# Altium project IndoorGuide_Anchor_Device_V1.0.0.PrjPcb
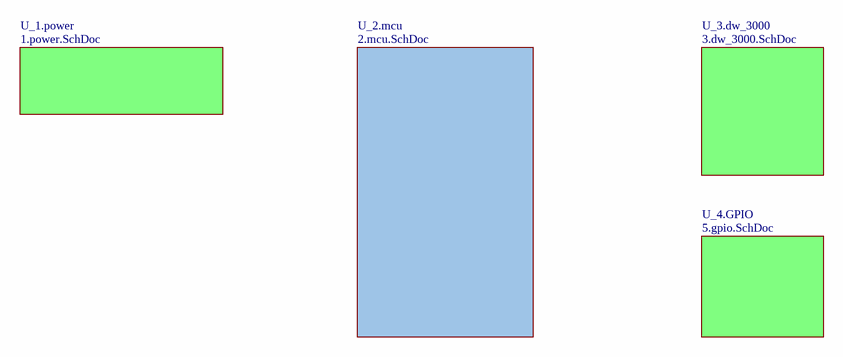
[diagram p0: 0.main.SchDoc]
Drawnby: FYP20-G22; Revision: 1.0.0; title: Indoor_Guide_Anchor_Device_V1.0.0
5 sheets, 12 parts. Net scope: hierarchical (ports join the sheet entries above them; power ports are global).
Board file: IndoorGuide_Anchor_Device_V1.0.0.PcbDoc
Sheets:
  0.main.SchDoc
    U_1.power = 1.power.SchDoc
    U_2.mcu = 2.mcu.SchDoc
    U_3.dw_3000 = 3.dw_3000.SchDoc
    U_4.GPIO = 5.gpio.SchDoc

## Sheet 0.main.SchDoc: Indoor_Guide_Anchor_Device_V1.0.0
size A4; Organization: ORGANIZATION; Address1: ADDRESS 1; Address2: ADDRESS 2; Address3: ADDRESS 3; Address4: ADDRESS 4; DocumentNumber: 1; SheetNumber: 1; SheetTotal: 5; ENG_APP_DATE: --/--/--; DSN_APP_DATE: --/--/--; CHK_APP_DATE: --/--/--; Page: Top

### Sub-sheets
U_1.power = 1.power.SchDoc: no entries
U_2.mcu = 2.mcu.SchDoc: no entries
U_3.dw_3000 = 3.dw_3000.SchDoc: no entries
U_4.GPIO = 5.gpio.SchDoc: no entries

### Notes on the sheet
- Title :
- Size:
- Date:
- Page :
- A4
- Number:
- Time:
- Revision:
- Sheet
- of
- Sheet Name :
- Drawn By :

## Sheet 1.power.SchDoc: Indoor_Guide_Anchor_Device_V1.0.0
size A4; Organization: ORGANIZATION; Address1: ADDRESS 1; Address2: ADDRESS 2; Address3: ADDRESS 3; Address4: ADDRESS 4; DocumentNumber: 2; SheetNumber: 2; SheetTotal: 5; ENG_APP_DATE: --/--/--; DSN_APP_DATE: --/--/--; CHK_APP_DATE: --/--/--; Page: Power Section
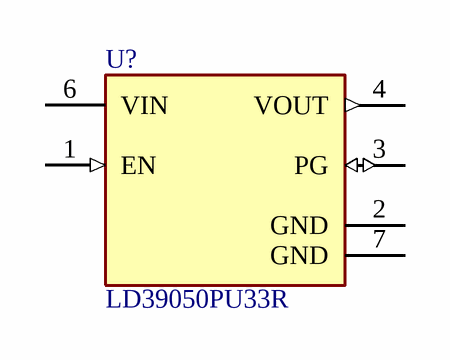
[diagram p1: 1.power.SchDoc]

### Parts
(Parts that share a designator on the sheet are numbered #1, #2 ... from top to bottom, then left to right.)
U?#1  LD39050PU33R  [SON95P300X300X100-7N]

### Nets

Not connected (* = marked no-connect by the designer): U?#1 1(EN) 2(GND) 3(PG) 4(VOUT) 6(VIN) 7(GND)

### Notes on the sheet
- Title :
- Size:
- Date:
- Page :
- A4
- Number:
- Time:
- Revision:
- Sheet
- of
- Sheet Name :
- Drawn By :

### Library data of the parts
U?#1 = LD39050PU33R: Linear Voltage Regulator IC Positive Fixed 1 Output 500mA 6-DFN (3x3); MF: STMicroelectronics; SnapEDA_Link: https://www.snapeda.com/parts/LD39050PU33R/STMicroelectronics/view-part/?ref=snap; Package: DFN-6 STMicroelectronics; Value: *; MP: LD39050PU33R; Check_prices: https://www.snapeda.com/parts/LD39050PU33R/STMicroelectronics/view-part/?ref=eda

## Sheet 2.mcu.SchDoc: Indoor_Guide_Anchor_Device_V1.0.0
size A4; Organization: ORGANIZATION; Address1: ADDRESS 1; Address2: ADDRESS 2; Address3: ADDRESS 3; Address4: ADDRESS 4; DocumentNumber: 3; SheetNumber: 3; SheetTotal: 5; ENG_APP_DATE: --/--/--; DSN_APP_DATE: --/--/--; CHK_APP_DATE: --/--/--; Page: MCU
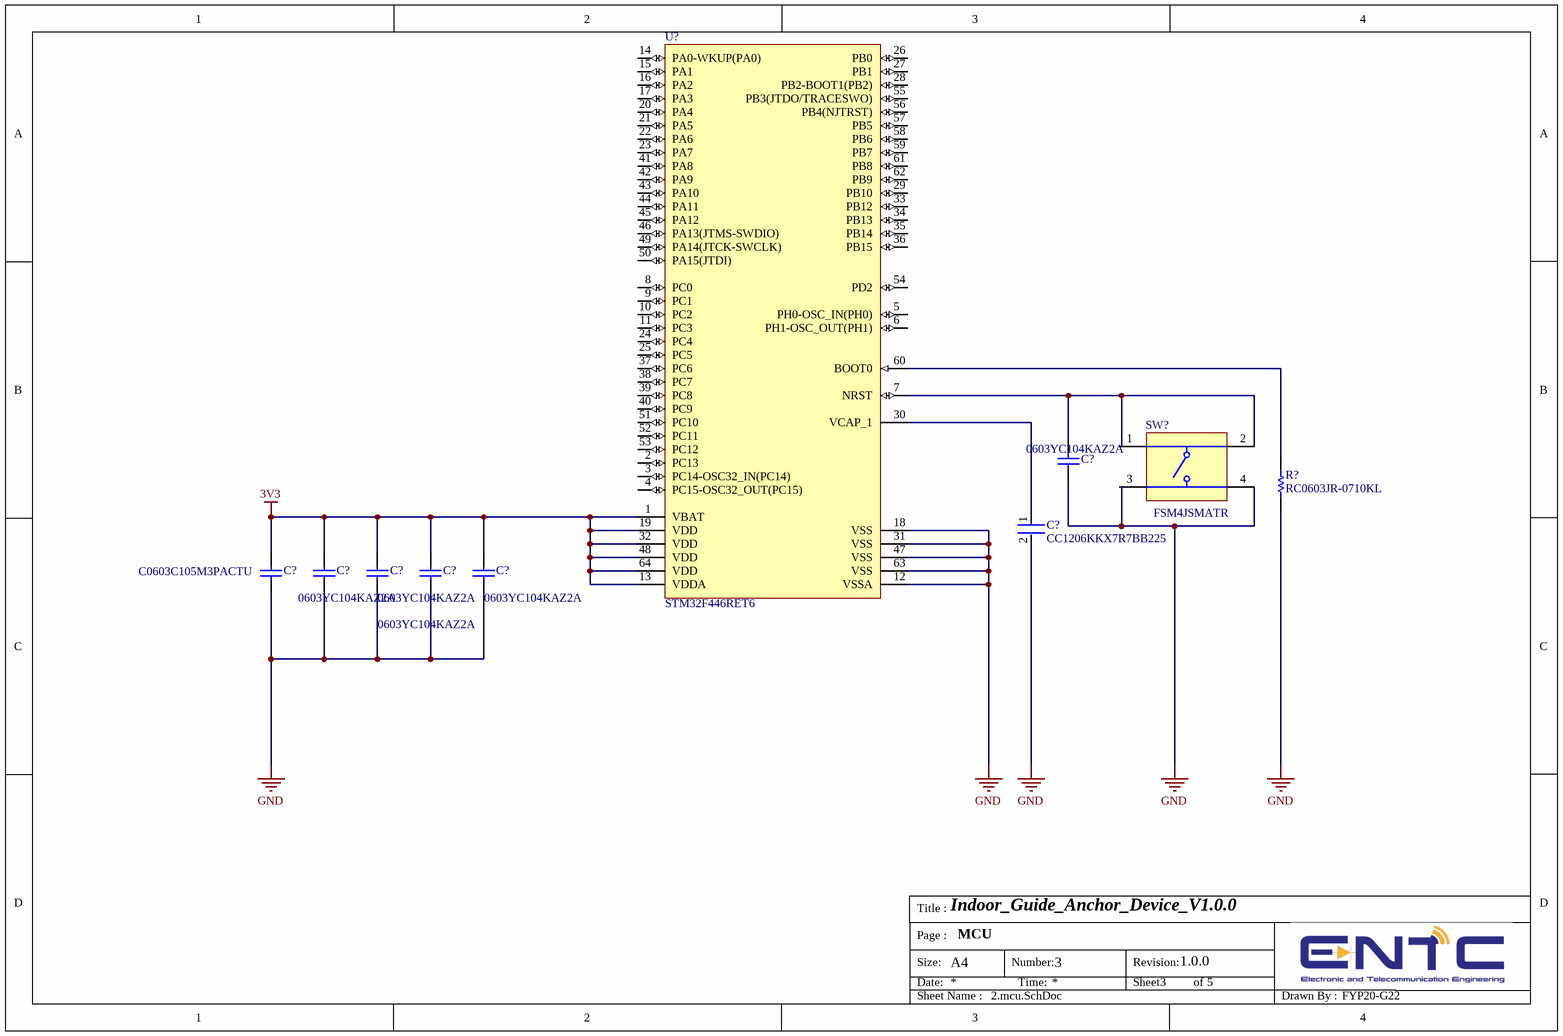
[diagram p2: 2.mcu.SchDoc]

### Parts
(Parts that share a designator on the sheet are numbered #1, #2 ... from top to bottom, then left to right.)
C?#1  0603YC104KAZ2A  [CAPC1608X90X35ML15T15]
C?#2  CC1206KKX7R7BB225  [FP-CC1206-1_25-MFG]
C?#3  C0603C105M3PACTU  [CAPC1608X90X35ML15T15]
C?#4  0603YC104KAZ2A  [CAPC1608X90X35ML15T15]
C?#5  0603YC104KAZ2A  [CAPC1608X90X35ML15T15]
C?#6  0603YC104KAZ2A  [CAPC1608X90X35ML15T15]
C?#7  0603YC104KAZ2A  [CAPC1608X90X35ML15T15]
R?  RC0603JR-0710KL  [RESC1608X55X25ML10T15]
SW?  FSM4JSMATR  [TECO-FSM4JSMATR_V]
U?#2  STM32F446RET6

### Nets
3V3: C?#3.2 C?#4.2 C?#5.2 C?#6.2 C?#7.2 U?#2.1(VBAT) U?#2.13(VDDA) U?#2.19(VDD) U?#2.32(VDD) U?#2.48(VDD) U?#2.64(VDD)
GND: C?#1.1 C?#2.2 C?#3.1 C?#4.1 C?#5.1 C?#6.1 C?#7.1 R?.1 SW?.3 SW?.4 U?#2.12(VSSA) U?#2.18(VSS) U?#2.31(VSS) U?#2.47(VSS) U?#2.63(VSS)
NetC?#1_2: C?#1.2 SW?.1 SW?.2 U?#2.7(NRST)
NetC?#2_1: C?#2.1 U?#2.30(VCAP_1)
NetR?_2: R?.2 U?#2.60(BOOT0)

Not connected (* = marked no-connect by the designer): U?#2 2(PC13) 3(PC14-OSC32_IN(PC14)) 4(PC15-OSC32_OUT(PC15)) 5(PH0-OSC_IN(PH0)) 6(PH1-OSC_OUT(PH1)) 8(PC0) 9(PC1) 10(PC2) 11(PC3) 14(PA0-WKUP(PA0)) 15(PA1) 16(PA2) 17(PA3) 20(PA4) 21(PA5) 22(PA6) 23(PA7) 24(PC4) 25(PC5) 26(PB0) 27(PB1) 28(PB2-BOOT1(PB2)) 29(PB10) 33(PB12) 34(PB13) 35(PB14) 36(PB15) 37(PC6) 38(PC7) 39(PC8) 40(PC9) 41(PA8) 42(PA9) 43(PA10) 44(PA11) 45(PA12) 46(PA13(JTMS-SWDIO)) 49(PA14(JTCK-SWCLK)) 50(PA15(JTDI)) 51(PC10) 52(PC11) 53(PC12) 54(PD2) 55(PB3(JTDO/TRACESWO)) 56(PB4(NJTRST)) 57(PB5) 58(PB6) 59(PB7) 61(PB8) 62(PB9)

### Notes on the sheet
- Title :
- Size:
- Date:
- Page :
- A4
- Number:
- Time:
- Revision:
- Sheet
- of
- Sheet Name :
- Drawn By :

### Library data of the parts
C?#1 C?#4-C?#7 = CMP-2006-04496-1: Manufacturer: AVX Interconnect / Elco; Part Number: 0603YC104KAZ2A
C?#2 = CMP-03422-001173-2: CAP CER 2.2UF 16V X7R 1206; Manufacturer: Yageo; Temperature Coefficient: 15%; Tolerance: 0.1; Material: Ceramic; Automotive Grade: NA; Lead Free: Yes; Device Class L3: Ceramic Capacitors; ComponentLink2Description: Datasheet; Device Class L2: Capacitors; Device Class L1: Passive Components; Mouser Description: Surface Mount Ceramic Multilayer Capacitor 2.2uF 10% X7R 16V 1206 Blister T/R; Octopart: https://octopart.com/cc1206kkx7r7bb225-yageo-8376579; Automotive: No; Voltage Rating: 16 V; Temperature Characteristic: X7R; Height: 1.45mm; Temperature: -55°C to +125°C; ComponentLink2URL: http://www.yageo.com/documents/recent/UPY-NP0X7R_HV_1KV-to-3KV_11.pdf; Digikey Description: CAP CER 2.2UF 16V X7R 1206; RoHS: TRUE; Capacitance: 2.2 uF; Footprint Url: http://www.yageo.com/exep/pages/download/literatures/UPY-C_GEN_24.pdf; Value: 2.2 uF; Category: Cap; Temperature Range Low: -55°C; Temperature Range High: +125°C; Manufacturer Part Number: CC1206KKX7R7BB225; Package: CC1206-1.25
C?#3 = CMP-1035-02741-2: Manufacturer: Kemet; Part Number: C0603C105M3PACTU
R? = CMP-2000-05022-1: Resistor, 10 KOhm, +/- 5%, 100 mW, -55 to 155 degC, 0603 (1608 Metric), RoHS, Tape and Reel; Manufacturer: Yageo; Resistance: 10kOhms; Voltage Rating: 50V; Temperature Coefficient: 100PPM/C; Power Rating: 100mW; Package Reference: 603; Series: RC; Case Code - mm: 1608; Packaging: Reel; Datasheet URL: http://www.farnell.com/datasheets/443971.pdf; Datasheet Version: Rev. 4, 04/2009; Operating Temperature Range: -55Cto+155C; Product: ThickFilmResistorsGeneralPurpose; Package Description: 2-Pin Surface Mount Device, Body 1.6 x 0.8 mm; Manufacturer URL: http://www.yageo.com/; Case Code - in: 0603; Tolerance: 5%; Termination Style: SMD/SMT
SW? = CMP-2000-07486-1: Micro Miniature Push Button Switch FSM JSM, 50 mA, -35 to 85 degC, 4-Pin SMD, RoHS, Tape and Reel; Manufacturer: TE Connectivity; Mechanical Life: 100000Cycles; Current Rating: 50mA; Actuator Material: Polyamide; Max Voltage Rating (DC): 12V; Capacitance: 0f; Illumination Type: Illuminated; Voltage Rating (DC): 24V; Case\/Package: SMD/SMT; Operating Force: 160gf; Contact Resistance: 100mOhm; Actuator Length: 0.055inch; Switch Travel: 0.25mm; Throw Configuration: SPST; Termination: GullWing; Contact Plating: Silver; Orientation: Straight; Mounting Technology: SurfaceMount; REACH SVHC: Unknown; Electrical Life: 100000Cycles; Package Reference: FSM4JSMATR; Max Operating Temperature: 85degC; Manufacturer URL: http://www.te.com/; Package Description: 4-Pin Surface Mount Device, Body 6 x 6 mm, Pitch 4.5 mm; Datasheet Version: Rev. V, 02/2015; Packaging: TapeandReel; Min Operating Temperature: -35degC; Mount: SurfaceMount; Contact Current Rating: 50mA; Contact Material: CopperAlloy; Package Quantity: 1200; Datasheet URL: http://www.te.com/commerce/DocumentDelivery/DDEController?Action=showdoc&DocId=Customer+Drawing%7F2-1437565-7%7FV%7Fpdf%7FEnglish%7FENG_CD_2-1437565-7_V.pdf%7F4-1437565-2; RoHSCompliant: true
U?#2 = MC-ARM-STM32F446-LQFP64: ARM Cortex-M4 32-bit MCU+FPU, 512 KB Flash, 128 KB Internal RAM, 50 I/Os, 64-Pin LQFP, -40 to 85 degC, Tray; I/Os (High Current): 50; Supply Voltage(Vcc) min (V): 1.7; Operating Frequency(F) (Processor speed) (MHz): 180; D/A Converter: 2; Internal RAM Size (kB): 128; FLASH Size (Prog) (kB): 512; Core: ARM Cortex-M4; ComponentLink1Description: Manufacturer URL; Package Reference: 64-Pin Low-profile Quad Flat Package, Body 10 x 10 mm, Pitch 0.5 mm; ComponentLink2URL: http://www.st.com/st-web-ui/static/active/en/resource/technical/document/datasheet/DM00141306.pdf; Packing: Tray; DatasheetVersion: Rev. 6; ComponentLink1URL: http://www.st.com/; ComponentLink2Description: Datasheet; Package Description: LQFP64; Mounting Technology: Surface Mount

## Sheet 3.dw_3000.SchDoc: Indoor_Guide_Anchor_Device_V1.0.0
size A4; Organization: ORGANIZATION; Address1: ADDRESS 1; Address2: ADDRESS 2; Address3: ADDRESS 3; Address4: ADDRESS 4; DocumentNumber: 4; SheetNumber: 4; SheetTotal: 5; ENG_APP_DATE: --/--/--; DSN_APP_DATE: --/--/--; CHK_APP_DATE: --/--/--; Page: DWM3000
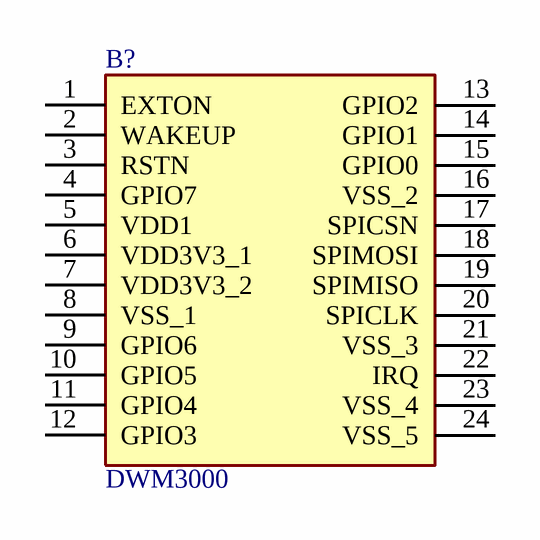
[diagram p3: 3.dw_3000.SchDoc]

### Parts
B?  DWM3000  [DWM3000]

### Nets

Not connected (* = marked no-connect by the designer): B? 1(EXTON) 2(WAKEUP) 3(RSTN) 4(GPIO7) 5(VDD1) 6(VDD3V3_1) 7(VDD3V3_2) 8(VSS_1) 9(GPIO6) 10(GPIO5) 11(GPIO4) 12(GPIO3) 13(GPIO2) 14(GPIO1) 15(GPIO0) 16(VSS_2) 17(SPICSN) 18(SPIMOSI) 19(SPIMISO) 20(SPICLK) 21(VSS_3) 22(IRQ) 23(VSS_4) 24(VSS_5)

### Notes on the sheet
- Title :
- Size:
- Date:
- Page :
- A4
- Number:
- Time:
- Revision:
- Sheet
- of
- Sheet Name :
- Drawn By :

### Library data of the parts
B? = DWM3000: 6.5 & 8.0 GHz Ultra-Wideband (UWB) Module,Supply voltage: 2.5 to 3.6 V (VDD3V3), 1.62 to 3.6 V (VDD1).; Manufacturer_Name: Qorvo; Geometry.Height: 2.89mm; Manufacturer_Part_Number: DWM3000; Mouser Part Number: N/A; Mouser Price/Stock: https://www.mouser.co.uk/ProductDetail/Qorvo/DWM3000?qs=iLbezkQI%252BsgcUwU6rIS9AQ%3D%3D; Arrow Part Number: *; Arrow Price/Stock: *; Datasheet Link: https://www.qorvo.com/products/p/DWM3000#documents

## Sheet 5.gpio.SchDoc: Indoor_Guide_Anchor_Device_V1.0.0
size A4; DocumentNumber: 5; SheetNumber: 5; SheetTotal: 5; Page: GPIO

### Notes on the sheet
- Title :
- Size:
- Date:
- Page :
- A4
- Number:
- Time:
- Revision:
- Sheet
- of
- Sheet Name :
- Drawn By :